# Altium schematic sheet UHF_Reader_MultiFunction.SchDoc
size A4; SheetNumber: 1; SheetTotal: 6
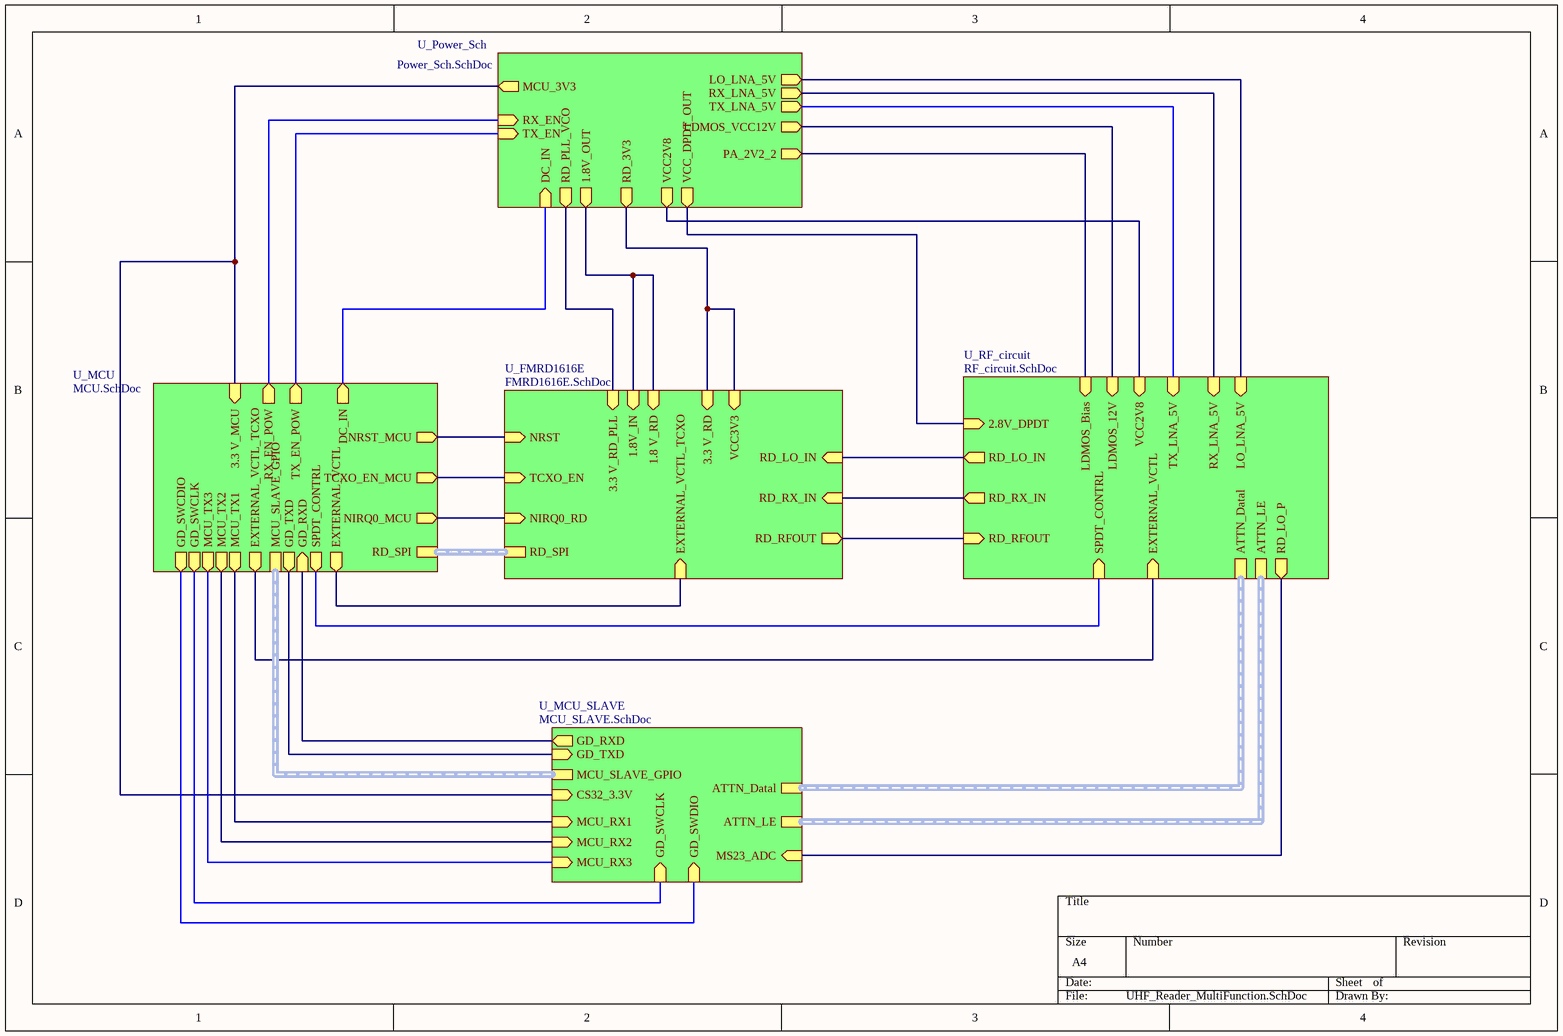
[diagram p0: UHF_Reader_MultiFunction.SchDoc]

## Sub-sheets
U_FMRD1616E = FMRD1616E.SchDoc: RD_RFOUT (out), 1.8 V_RD (in), NRST (in), TCXO_EN (in), NIRQ0_RD (in), 3.3 V_RD (in), RD_RX_IN (in), RD_LO_IN (in), RD_SPI (harness RD_SPI), 3.3 V_RD_PLL (in), VCC3V3 (in), 1.8V_IN (in), EXTERNAL_VCTL_TCXO (in)
U_MCU = MCU.SchDoc: 3.3 V_MCU (in), NRST_MCU (out), TCXO_EN_MCU (out), NIRQ0_MCU (out), RD_SPI (harness RD_SPI), MCU_TX1 (out), MCU_TX2 (out), DC_IN (out), SPDT_CONTRL (out), TX_EN_POW (out), RX_EN_POW (out), GD_SWCDIO (out), GD_SWCLK (out), MCU_TX3 (out), MCU_SLAVE_GPIO (harness MCU_SLAVE_OUT), EXTERNAL_VCTL_TCXO (out), EXTERNAL_VCTL (out), GD_TXD (out), GD_RXD (in)
U_MCU_SLAVE = MCU_SLAVE.SchDoc: CS32_3.3V (in), ATTN_Datal (harness ATTN1), ATTN_LE (harness ATTN_LE), MCU_RX1 (in), MCU_RX2 (in), MS23_ADC (in), GD_SWCLK (in), GD_SWDIO (in), MCU_RX3 (in), MCU_SLAVE_GPIO (harness MCU_SLAVE_OUT), GD_TXD (in), GD_RXD (out)
U_Power_Sch = Power_Sch.SchDoc: MCU_3V3 (out), VCC2V8 (out), PA_2V2_2 (out), LDMOS_VCC12V (out), RD_3V3 (out), RD_PLL_VCO (out), LO_LNA_5V (out), RX_LNA_5V (out), DC_IN (in), RX_EN (in), TX_EN (in), TX_LNA_5V (out), 1.8V_OUT (out), VCC_DPDT_OUT (out)
U_RF_circuit = RF_circuit.SchDoc: RD_RFOUT (in), LDMOS_Bias (in), LDMOS_12V (in), RD_LO_IN (out), RD_RX_IN (out), VCC2V8 (in), RD_LO_P (out), RX_LNA_5V (in), LO_LNA_5V (in), ATTN_Datal (harness ATTN1), ATTN_LE (harness ATTN_LE), SPDT_CONTRL (in), TX_LNA_5V (in), EXTERNAL_VCTL (in), 2.8V_DPDT (in)

## Nets
(unnamed): sheet U_FMRD1616E/RD_RFOUT, sheet U_RF_circuit/RD_RFOUT
(unnamed): sheet U_FMRD1616E/1.8 V_RD, sheet U_FMRD1616E/1.8V_IN, sheet U_Power_Sch/1.8V_OUT
(unnamed): sheet U_FMRD1616E/NRST, sheet U_MCU/NRST_MCU
(unnamed): sheet U_FMRD1616E/TCXO_EN, sheet U_MCU/TCXO_EN_MCU
(unnamed): sheet U_FMRD1616E/NIRQ0_RD, sheet U_MCU/NIRQ0_MCU
(unnamed): sheet U_FMRD1616E/3.3 V_RD, sheet U_FMRD1616E/VCC3V3, sheet U_Power_Sch/RD_3V3
(unnamed): sheet U_FMRD1616E/RD_RX_IN, sheet U_RF_circuit/RD_RX_IN
(unnamed): sheet U_FMRD1616E/RD_LO_IN, sheet U_RF_circuit/RD_LO_IN
(unnamed): sheet U_FMRD1616E/3.3 V_RD_PLL, sheet U_Power_Sch/RD_PLL_VCO
(unnamed): sheet U_FMRD1616E/EXTERNAL_VCTL_TCXO, sheet U_MCU/EXTERNAL_VCTL
(unnamed): sheet U_RF_circuit/LDMOS_Bias, sheet U_Power_Sch/PA_2V2_2
(unnamed): sheet U_RF_circuit/LDMOS_12V, sheet U_Power_Sch/LDMOS_VCC12V
(unnamed): sheet U_RF_circuit/VCC2V8, sheet U_Power_Sch/VCC2V8
(unnamed): sheet U_RF_circuit/RD_LO_P, sheet U_MCU_SLAVE/MS23_ADC
(unnamed): sheet U_RF_circuit/RX_LNA_5V, sheet U_Power_Sch/RX_LNA_5V
(unnamed): sheet U_RF_circuit/LO_LNA_5V, sheet U_Power_Sch/LO_LNA_5V
(unnamed): sheet U_RF_circuit/SPDT_CONTRL, sheet U_MCU/SPDT_CONTRL
(unnamed): sheet U_RF_circuit/TX_LNA_5V, sheet U_Power_Sch/TX_LNA_5V
(unnamed): sheet U_RF_circuit/EXTERNAL_VCTL, sheet U_MCU/EXTERNAL_VCTL_TCXO
(unnamed): sheet U_RF_circuit/2.8V_DPDT, sheet U_Power_Sch/VCC_DPDT_OUT
(unnamed): sheet U_MCU/3.3 V_MCU, sheet U_Power_Sch/MCU_3V3, sheet U_MCU_SLAVE/CS32_3.3V
(unnamed): sheet U_MCU/MCU_TX1, sheet U_MCU_SLAVE/MCU_RX1
(unnamed): sheet U_MCU/MCU_TX2, sheet U_MCU_SLAVE/MCU_RX2
(unnamed): sheet U_MCU/DC_IN, sheet U_Power_Sch/DC_IN
(unnamed): sheet U_MCU/TX_EN_POW, sheet U_Power_Sch/TX_EN
(unnamed): sheet U_MCU/RX_EN_POW, sheet U_Power_Sch/RX_EN
(unnamed): sheet U_MCU/GD_SWCDIO, sheet U_MCU_SLAVE/GD_SWDIO
(unnamed): sheet U_MCU/GD_SWCLK, sheet U_MCU_SLAVE/GD_SWCLK
(unnamed): sheet U_MCU/MCU_TX3, sheet U_MCU_SLAVE/MCU_RX3
(unnamed): sheet U_MCU/GD_TXD, sheet U_MCU_SLAVE/GD_TXD
(unnamed): sheet U_MCU/GD_RXD, sheet U_MCU_SLAVE/GD_RXD

## Buses and harness runs
harness sheet U_FMRD1616E/RD_SPI = sheet U_MCU/RD_SPI
harness sheet U_MCU/MCU_SLAVE_GPIO = sheet U_MCU_SLAVE/MCU_SLAVE_GPIO
harness sheet U_MCU_SLAVE/ATTN_Datal = sheet U_RF_circuit/ATTN_Datal
harness sheet U_MCU_SLAVE/ATTN_LE = sheet U_RF_circuit/ATTN_LE